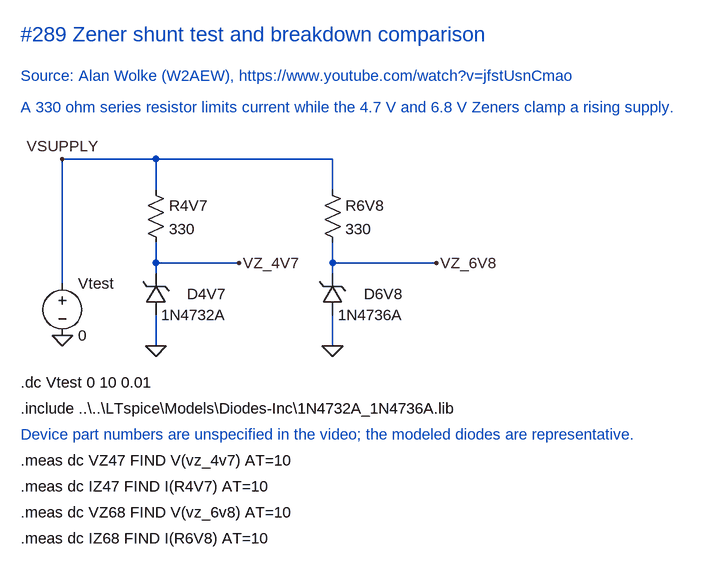
[diagram p0: schematic Zener shunt test and comparison.asc]
Zener shunt test and comparison.asc, the LTspice schematic file:
Version 4
SHEET 1 900 720
WIRE 128 224 128 416
WIRE 272 224 128 224
WIRE 544 224 272 224
WIRE 272 272 272 224
WIRE 544 272 544 224
WIRE 272 400 272 352
WIRE 544 400 544 352
WIRE 400 384 272 384
WIRE 704 384 544 384
WIRE 272 512 272 464
WIRE 544 512 544 464
FLAG 128 496 0
FLAG 128 224 VSUPPLY
FLAG 272 512 0
FLAG 544 512 0
FLAG 400 384 VZ_4V7
FLAG 704 384 VZ_6V8
SYMBOL voltage 128 400 R0
SYMATTR InstName Vtest
SYMATTR Value 0
SYMBOL res 256 256 R0
SYMATTR InstName R4V7
SYMATTR Value 330
SYMBOL res 528 256 R0
SYMATTR InstName R6V8
SYMATTR Value 330
SYMBOL zener 256 464 M180
WINDOW 0 64 32 Left 2
WINDOW 3 24 0 Left 2
SYMATTR InstName D4V7
SYMATTR Value 1N4732A
SYMATTR Prefix X
SYMBOL zener 528 464 M180
WINDOW 0 64 32 Left 2
WINDOW 3 24 0 Left 2
SYMATTR InstName D6V8
SYMATTR Value 1N4736A
SYMATTR Prefix X
TEXT 64 32 Left 3 ;#289 Zener shunt test and breakdown comparison
TEXT 64 96 Left 2 ;Source: Alan Wolke (W2AEW), https://www.youtube.com/watch?v=jfstUsnCmao
TEXT 64 144 Left 2 ;A 330 ohm series resistor limits current while the 4.7 V and 6.8 V Zeners clamp a rising supply.
TEXT 64 568 Left 2 !.dc Vtest 0 10 0.01
TEXT 64 608 Left 2 !.include ..\..\LTspice\Models\Diodes-Inc\1N4732A_1N4736A.lib
TEXT 64 648 Left 2 ;Device part numbers are unspecified in the video; the modeled diodes are representative.
TEXT 64 688 Left 2 !.meas dc VZ47 FIND V(vz_4v7) AT=10
TEXT 64 728 Left 2 !.meas dc IZ47 FIND I(R4V7) AT=10
TEXT 64 768 Left 2 !.meas dc VZ68 FIND V(vz_6v8) AT=10
TEXT 64 808 Left 2 !.meas dc IZ68 FIND I(R6V8) AT=10

The netlist it stands for:
* Zener shunt test and comparison.asc
Vtest VSUPPLY 0 0
R4V7 VSUPPLY VZ_4V7 330
R6V8 VSUPPLY VZ_6V8 330
XD4V7 0 VZ_4V7 1N4732A  ; pins + -
XD6V8 0 VZ_6V8 1N4736A  ; pins + -
* #289 Zener shunt test and breakdown comparison
* Source: Alan Wolke (W2AEW), https://www.youtube.com/watch?v=jfstUsnCmao
* A 330 ohm series resistor limits current while the 4.7 V and 6.8 V Zeners clamp a rising supply.
.dc Vtest 0 10 0.01
.include ..\..\LTspice\Models\Diodes-Inc\1N4732A_1N4736A.lib
* Device part numbers are unspecified in the video; the modeled diodes are representative.
.meas dc VZ47 FIND V(vz_4v7) AT=10
.meas dc IZ47 FIND I(R4V7) AT=10
.meas dc VZ68 FIND V(vz_6v8) AT=10
.meas dc IZ68 FIND I(R6V8) AT=10
.backanno
.end